# Altium schematic sheet Motor_Sheet.SchDoc
size B; DocumentNumber: 4; SheetNumber: 4; SheetTotal: 7
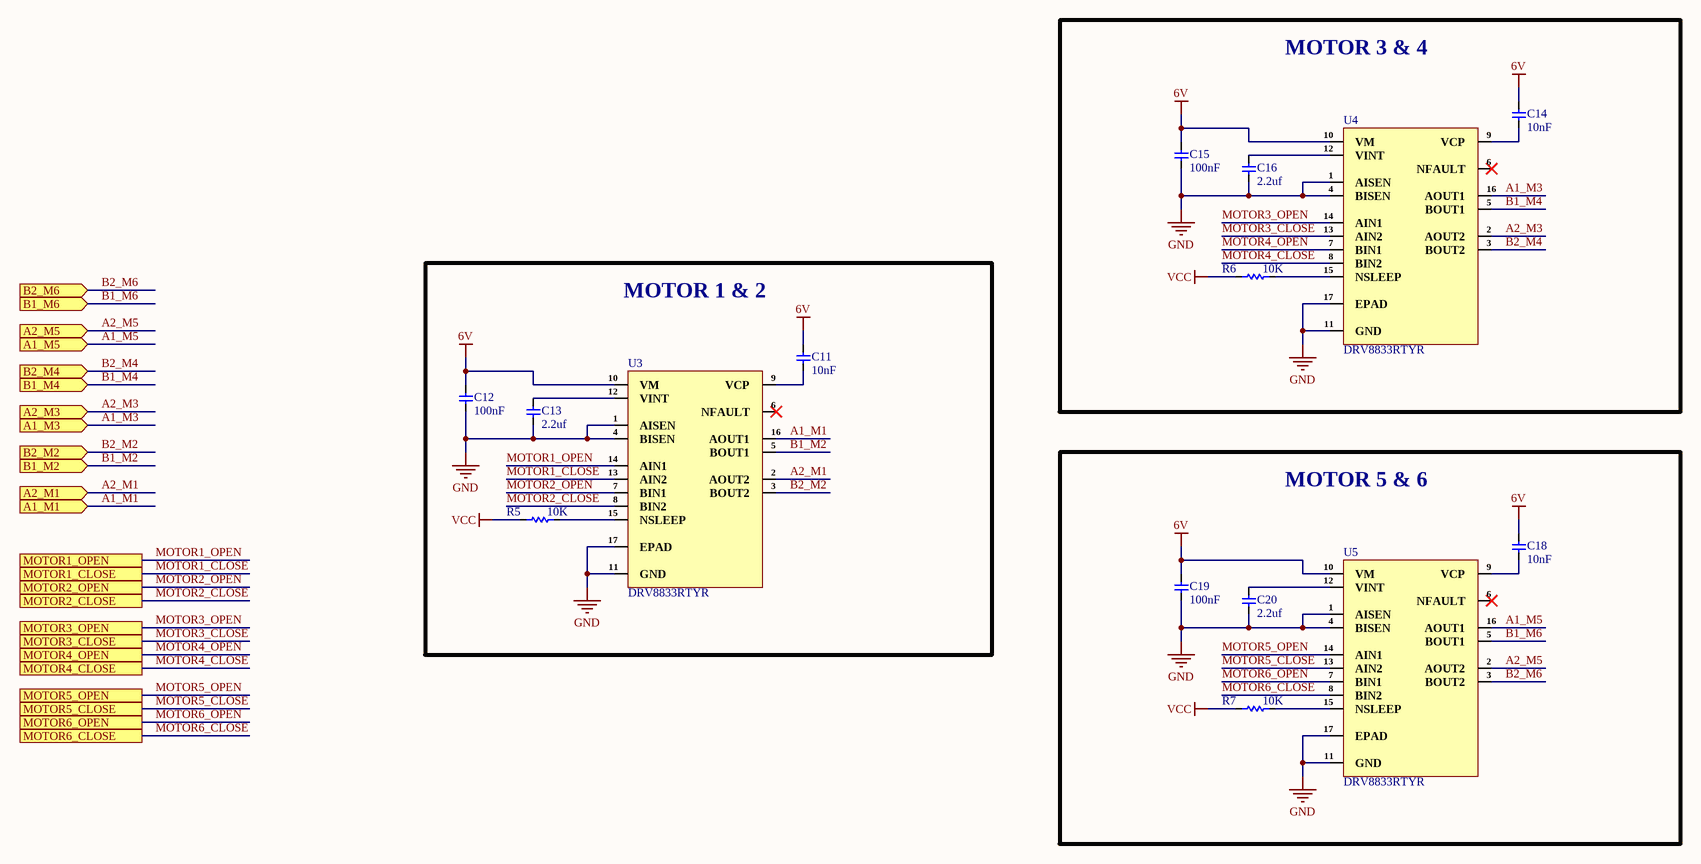
[diagram p0: Motor_Sheet.SchDoc]

## Parts
C11  10nF  [Cap-0402]
C12  100nF  [Cap-0402]
C13  2.2uf  [Cap-0402]
C14  10nF  [Cap-0402]
C15  100nF  [Cap-0402]
C16  2.2uf  [Cap-0402]
C18  10nF  [Cap-0402]
C19  100nF  [Cap-0402]
C20  2.2uf  [Cap-0402]
R5  10K  [Res-0402]
R6  10K  [Res-0402]
R7  10K  [Res-0402]
U3  DRV8833RTYR  [QFN-16-EP(4x4)]
U4  DRV8833RTYR  [QFN-16-EP(4x4)]
U5  DRV8833RTYR  [QFN-16-EP(4x4)]

## Blocks framed on the sheet
MOTOR 3 & 4: C14-C16 R6 U4
MOTOR 1 & 2: C11-C13 R5 U3
MOTOR 5 & 6: C18-C20 R7 U5

## Ports
A1_M1 (in), A1_M3 (in), A1_M5 (in), A2_M1 (in), A2_M3 (in), A2_M5 (in), B1_M2 (in), B1_M4 (in), B1_M6 (in), B2_M2 (in), B2_M4 (in), B2_M6 (in), MOTOR1_CLOSE, MOTOR1_OPEN, MOTOR2_CLOSE, MOTOR2_OPEN, MOTOR3_CLOSE, MOTOR3_OPEN, MOTOR4_CLOSE, MOTOR4_OPEN, MOTOR5_CLOSE, MOTOR5_OPEN, MOTOR6_CLOSE, MOTOR6_OPEN

## Nets
6V: C11.2 C12.2 C14.2 C15.2 C18.2 C19.2 U3.10(VM) U4.10(VM) U5.10(VM)
GND: C12.1 C13.1 C15.1 C16.1 C19.1 C20.1 U3.1(AISEN) U3.4(BISEN) U3.11(GND) U3.17(EPAD) U4.1(AISEN) U4.4(BISEN) U4.11(GND) U4.17(EPAD) U5.1(AISEN) U5.4(BISEN) U5.11(GND) U5.17(EPAD)
VCC: R5.1 R6.1 R7.1
A1_M1: U3.16(AOUT1) ; port A1_M1
A1_M3: U4.16(AOUT1) ; port A1_M3
A1_M5: U5.16(AOUT1) ; port A1_M5
A2_M1: U3.2(AOUT2) ; port A2_M1
A2_M3: U4.2(AOUT2) ; port A2_M3
A2_M5: U5.2(AOUT2) ; port A2_M5
B1_M2: U3.5(BOUT1) ; port B1_M2
B1_M4: U4.5(BOUT1) ; port B1_M4
B1_M6: U5.5(BOUT1) ; port B1_M6
B2_M2: U3.3(BOUT2) ; port B2_M2
B2_M4: U4.3(BOUT2) ; port B2_M4
B2_M6: U5.3(BOUT2) ; port B2_M6
MOTOR1_CLOSE: U3.13(AIN2) ; port MOTOR1_CLOSE
MOTOR1_OPEN: U3.14(AIN1) ; port MOTOR1_OPEN
MOTOR2_CLOSE: U3.8(BIN2) ; port MOTOR2_CLOSE
MOTOR2_OPEN: U3.7(BIN1) ; port MOTOR2_OPEN
MOTOR3_CLOSE: U4.13(AIN2) ; port MOTOR3_CLOSE
MOTOR3_OPEN: U4.14(AIN1) ; port MOTOR3_OPEN
MOTOR4_CLOSE: U4.8(BIN2) ; port MOTOR4_CLOSE
MOTOR4_OPEN: U4.7(BIN1) ; port MOTOR4_OPEN
MOTOR5_CLOSE: U5.13(AIN2) ; port MOTOR5_CLOSE
MOTOR5_OPEN: U5.14(AIN1) ; port MOTOR5_OPEN
MOTOR6_CLOSE: U5.8(BIN2) ; port MOTOR6_CLOSE
MOTOR6_OPEN: U5.7(BIN1) ; port MOTOR6_OPEN
NetC11_1: C11.1 U3.9(VCP)
NetC13_2: C13.2 U3.12(VINT)
NetC14_1: C14.1 U4.9(VCP)
NetC16_2: C16.2 U4.12(VINT)
NetC18_1: C18.1 U5.9(VCP)
NetC20_2: C20.2 U5.12(VINT)
NetR5_2: R5.2 U3.15(NSLEEP)
NetR6_2: R6.2 U4.15(NSLEEP)
NetR7_2: R7.2 U5.15(NSLEEP)

Not connected (* = marked no-connect by the designer): U3 6(NFAULT)*; U4 6(NFAULT)*; U5 6(NFAULT)*

## Library data of the parts
C11 C14 C18 = CC0402KRX7R9BB103: CAP CER 10000PF 50V X7R 0402; Manufacturer: Yageo; Tolerance: 10%; Item Type: Capacitor; Supplier 1: Avnet; Manufacturer Part Number: CC0402KRX7R9BB103; RoHS: Yes; Category: Ceramic Capacitors; Stock 1: 995000; Pricing 1: 10000=0.00178 (USD); Mount: Surface Mount; Case/Package: 0402; Case Code (Imperial): 0402; Case Code (Metric): 1005; Min Operating Temperature: -55°C; Max Operating Temperature: 125°C; Capacitance: 10nF; Dielectric: X7R; Packaging: Tape and Reel; Voltage Rating: 50V; Voltage Rating (DC): 50V; Package Quantity: 1; Termination: SMD/SMT; Resistor Type: Ceramic; Voltage: 50V; Series: CC; Length: 1mm; Width: 0.02inch; Height: 0.5mm; Thickness: 0.022inch; Depth: 0.5mm; Radiation Hardening: No; RoHS Compliant: Yes; Reach SVHC Compliant: Yes; Lead Free: Lead Free; Halogen Free: Halogen Free; ComponentLink1URL: https://datasheet.ciiva.com/11788/0900766b8079c870-11788375.pdf?src-supplier=RSComponents; ComponentLink1Description: https://datasheet.ciiva.com/11788/0900766b8079c870-11788375.pdf?src-supplier=RSComponents; ComponentLink2URL: https://datasheet.ciiva.com/26862/getdatasheetpartid-138248-26862642.pdf?src-supplier=Verical; ComponentLink2Description: https://datasheet.ciiva.com/26862/getdatasheetpartid-138248-26862642.pdf?src-supplier=Verical; ComponentLink3URL: https://datasheet.ciiva.com/7978/1489800-7978093.pdf?src-supplier=Element14; ComponentLink3Description: https://datasheet.ciiva.com/7978/1489800-7978093.pdf?src-supplier=Element14; ComponentLink4URL: https://datasheet.ciiva.com/28450/1489800-28450377.pdf?src-supplier=Element14; ComponentLink4Description: https://datasheet.ciiva.com/28450/1489800-28450377.pdf?src-supplier=Element14; ComponentLink5URL: https://datasheet.ciiva.com/176/mlccorderingcode-176349.pdf?src-supplier=Digi-Key; ComponentLink5Description: https://datasheet.ciiva.com/176/mlccorderingcode-176349.pdf?src-supplier=Digi-Key; ComponentLink6URL: https://datasheet.ciiva.com/176/mlccorderingcode-176348.pdf?src-supplier=Digi-Key; ComponentLink6Description: https://datasheet.ciiva.com/176/mlccorderingcode-176348.pdf?src-supplier=Digi-Key; ComponentLink7URL: https://datasheet.ciiva.com/176/mlccorderingcode-176350.pdf?src-supplier=Digi-Key; ComponentLink7Description: https://datasheet.ciiva.com/176/mlccorderingcode-176350.pdf?src-supplier=Digi-Key; Supplier Part Number 1: CC0402KRX7R9BB103; LCSC Part Number: C60133
C12 C15 C19 = CC0402KRX5R8BB104: CAP CER 0.1UF 25V X5R 0402; Manufacturer: Yageo; Tolerance: 10%; Item Type: Capacitor; Supplier 1: Digi-Key; Manufacturer Part Number: CC0402KRX5R8BB104; RoHS: Yes; Category: Ceramic Capacitors; Stock 1: 4598218; Pricing 1: 1=0.10000, 10=0.03800, 50=0.02100, 100=0.01710, 500=0.01224, 1000=0.00961, 2500=0.00874, 5000=0.00804 (USD); Mount: Surface Mount; Case/Package: 0402; Case Code (Metric): 1005; Case Code (Imperial): 0402; Min Operating Temperature: -55°C; Max Operating Temperature: 85°C; Voltage Rating: 25V; Packaging: Tape and Reel; Capacitance: 100nF; Voltage Rating (DC): 25V; Dielectric: X5R; Resistor Type: Ceramic; Series: CC; Length: 0.039inch; Width: 0.02inch; Thickness: 0.022inch; Depth: 0.5mm; Lead Free: Lead Free; Halogen Free: Halogen Free; RoHS Compliant: Yes; ComponentLink1URL: http://www.mouser.com/ds/2/447/UPY-GPHC_X5R_4V-to-50V_25-1131599.pdf?src-supplier=Mouser; ComponentLink1Description: http://www.mouser.com/ds/2/447/UPY-GPHC_X5R_4V-to-50V_25-1131599.pdf?src-supplier=Mouser; ComponentLink2URL: http://www.yageo.com/documents/recent/UPY-GPHC_X5R_4V-to-50V-16.pdf?src-supplier=Future+Electronics; ComponentLink2Description: http://www.yageo.com/documents/recent/UPY-GPHC_X5R_4V-to-50V-16.pdf?src-supplier=Future+Electronics; ComponentLink3URL: http://www.yageo.com/documents/recent/UPY-GPHC_X5R_4V-to-50V_25.pdf?src-supplier=Digi-Key; ComponentLink3Description: http://www.yageo.com/documents/recent/UPY-GPHC_X5R_4V-to-50V_25.pdf?src-supplier=Digi-Key; Supplier Part Number 1: 311-1697-1-ND; LCSC Part Number: C106256
C13 C16 C20 = GRM155R61E225KE11D: CAP CER 2.2UF 25V X5R 0402; Manufacturer: Murata; Material: Ceramic; Tolerance: 10%; Item Type: Capacitor; Supplier 1: Avnet; Manufacturer Part Number: GRM155R61E225KE11D; RoHS: Yes; Category: Ceramic Capacitors; Stock 1: 210000; Pricing 1: 10000=0.03830, 20000=0.03623, 40000=0.03416, 60000=0.03209, 80000=0.03002, 100000=0.02795, 1000000=0.02588 (USD); Mount: Surface Mount; Case/Package: 0402; Case Code (Metric): 1005; Case Code (Imperial): 0402; Weight: 0.000212oz; Min Operating Temperature: -55°C; Max Operating Temperature: 85°C; Dielectric: X5R; Capacitance: 2.2uF; Packaging: Tape and Reel; Voltage Rating: 25V; Termination: SMD/SMT; Resistor Type: Ceramic; Voltage Rating (DC): 25V; Package Quantity: 10000; Length: 1mm; Width: 0.5mm; Height: 0.5mm; Thickness: 0.022inch; Lead Free: Lead Free; RoHS Compliant: Yes; ComponentLink1URL: http://www.mouser.com/ds/2/281/c02e-2905.pdf?src-supplier=Mouser; ComponentLink1Description: http://www.mouser.com/ds/2/281/c02e-2905.pdf?src-supplier=Mouser; ComponentLink2URL: http://search.murata.co.jp/Ceramy/image/img/A01X/G101/ENG/GRM155R61E225KE11-01.pdf?src-supplier=Digi-Key; ComponentLink2Description: http://search.murata.co.jp/Ceramy/image/img/A01X/G101/ENG/GRM155R61E225KE11-01.pdf?src-supplier=Digi-Key; ComponentLink3URL: http://search.murata.co.jp/Ceramy/image/img/A01X/partnumbering_e_01.pdf?src-supplier=Digi-Key; ComponentLink3Description: http://search.murata.co.jp/Ceramy/image/img/A01X/partnumbering_e_01.pdf?src-supplier=Digi-Key; ComponentLink4URL: http://psearch.en.murata.com/capacitor/product/GRM155R61E225KE11%23.pdf?src-supplier=Avnet; ComponentLink4Description: http://psearch.en.murata.com/capacitor/product/GRM155R61E225KE11%23.pdf?src-supplier=Avnet; Supplier Part Number 1: GRM155R61E225KE11D; LCSC Part Number: C385032
R5-R7 = RC0402FR-0710KL: RES 10K OHM 1% 1/16W 0402; Manufacturer: Yageo; Resistance: 10kR; Voltage Rating (DC): 50V; Temperature Coefficient: 100ppm/°C; Power Rating: 62.5mW; Max Power Dissipation: 63mW; Item Type: Resistor; Supplier 1: Mouser; Manufacturer Part Number: RC0402FR-0710KL; RoHS: Yes; Category: Chip SMD Resistors; Stock 1: 18648329; Pricing 1: 1=0.10000, 10=0.01400, 50=0.01400, 100=0.00500, 1000=0.00300, 10000=0.00200 (USD); Case/Package: 0402; Number of Pins: 2; Case Code (Imperial): 0402; Case Code (Metric): 1005; Min Operating Temperature: -55°C; Max Operating Temperature: 155°C; Resistor Type: Thick Film; Tolerance: 1%; Packaging: Tape and Reel; Voltage Rating: 50V; Termination: SMD/SMT; Working Voltage: 50V; Number of Terminations: 2; Features: Moisture Resistant; Series: RC; Resistance Tolerance: 1%; Construction: Rectangular; Length: 1mm; Width: 0.5mm; Height: 0.32mm; Depth: 0.5mm; Lead Pitch: 0.2mm; REACH SVHC: No SVHC; Lead Free: Lead Free; RoHS Compliant: Yes; Military Standard: Not; ComponentLink1URL: https://datasheet.ciiva.com/7660/38568-7660787.pdf?src-supplier=Element14; ComponentLink1Description: https://datasheet.ciiva.com/7660/38568-7660787.pdf?src-supplier=Element14; ComponentLink2URL: https://datasheet.ciiva.com/7849/1686128-7849814.pdf?src-supplier=Element14; ComponentLink2Description: https://datasheet.ciiva.com/7849/1686128-7849814.pdf?src-supplier=Element14; ComponentLink3URL: https://datasheet.ciiva.com/7983/1018594-7983486.pdf?src-supplier=Element14; ComponentLink3Description: https://datasheet.ciiva.com/7983/1018594-7983486.pdf?src-supplier=Element14; ComponentLink4URL: https://datasheet.ciiva.com/22747/1018594-22747512.pdf?src-supplier=Element14; ComponentLink4Description: https://datasheet.ciiva.com/22747/1018594-22747512.pdf?src-supplier=Element14; ComponentLink5URL: https://datasheet.ciiva.com/12667/pyu-rc0402-51-rohs-l-6-r-12667067.pdf?src-supplier=Mouser; ComponentLink5Description: https://datasheet.ciiva.com/12667/pyu-rc0402-51-rohs-l-6-r-12667067.pdf?src-supplier=Mouser; ComponentLink6URL: https://datasheet.ciiva.com/7849/1784430-7849813.pdf?src-supplier=Element14; ComponentLink6Description: https://datasheet.ciiva.com/7849/1784430-7849813.pdf?src-supplier=Element14; ComponentLink7URL: https://datasheet.ciiva.com/7849/1784430-7849815.pdf?src-supplier=Element14; ComponentLink7Description: https://datasheet.ciiva.com/7849/1784430-7849815.pdf?src-supplier=Element14; Supplier Part Number 1: 603-RC0402FR-0710KL; LCSC Part Number: C60490
U3-U5 = DRV8833RTYR: IC MOTOR DRIVER PAR 16QFN; Manufacturer: Texas Instruments; Supplier: Mouser; Supplier Part Number: 595-DRV8833RTYR; Manufacturer Part Number: DRV8833RTYR; RoHS: Yes; Item Type: IC; Stock: 2803; Pricing: 1=1.6, 10=1.36, 50=1.36, 100=1.16, 1000=0.954, 10000=0.875 (USD); ComponentLink1URL: https://datasheet.ciiva.com/15109/getdatasheetpartid-567030-15109665.pdf?src-supplier=Verical; ComponentLink1Description: https://datasheet.ciiva.com/15109/getdatasheetpartid-567030-15109665.pdf?src-supplier=Verical; ComponentLink2URL: https://datasheet.ciiva.com/3229/drv8833-3229034.pdf?src-supplier=Avnet; ComponentLink2Description: https://datasheet.ciiva.com/3229/drv8833-3229034.pdf?src-supplier=Avnet; ComponentLink3URL: https://datasheet.ciiva.com/1959/drv8833-1959716.pdf?src-supplier=Digikey; ComponentLink3Description: https://datasheet.ciiva.com/1959/drv8833-1959716.pdf?src-supplier=Digikey; ComponentLink4URL: https://datasheet.ciiva.com/1959/drv8833-1959717.pdf?src-supplier=Digikey; ComponentLink4Description: https://datasheet.ciiva.com/1959/drv8833-1959717.pdf?src-supplier=Digikey; ComponentLink5URL: https://datasheet.ciiva.com/1959/drv8833-1959718.pdf?src-supplier=Digikey; ComponentLink5Description: https://datasheet.ciiva.com/1959/drv8833-1959718.pdf?src-supplier=Digikey; LCSC Part Number: C154936